# Altium schematic sheet GNT604PWRR4.SchDoc
size B
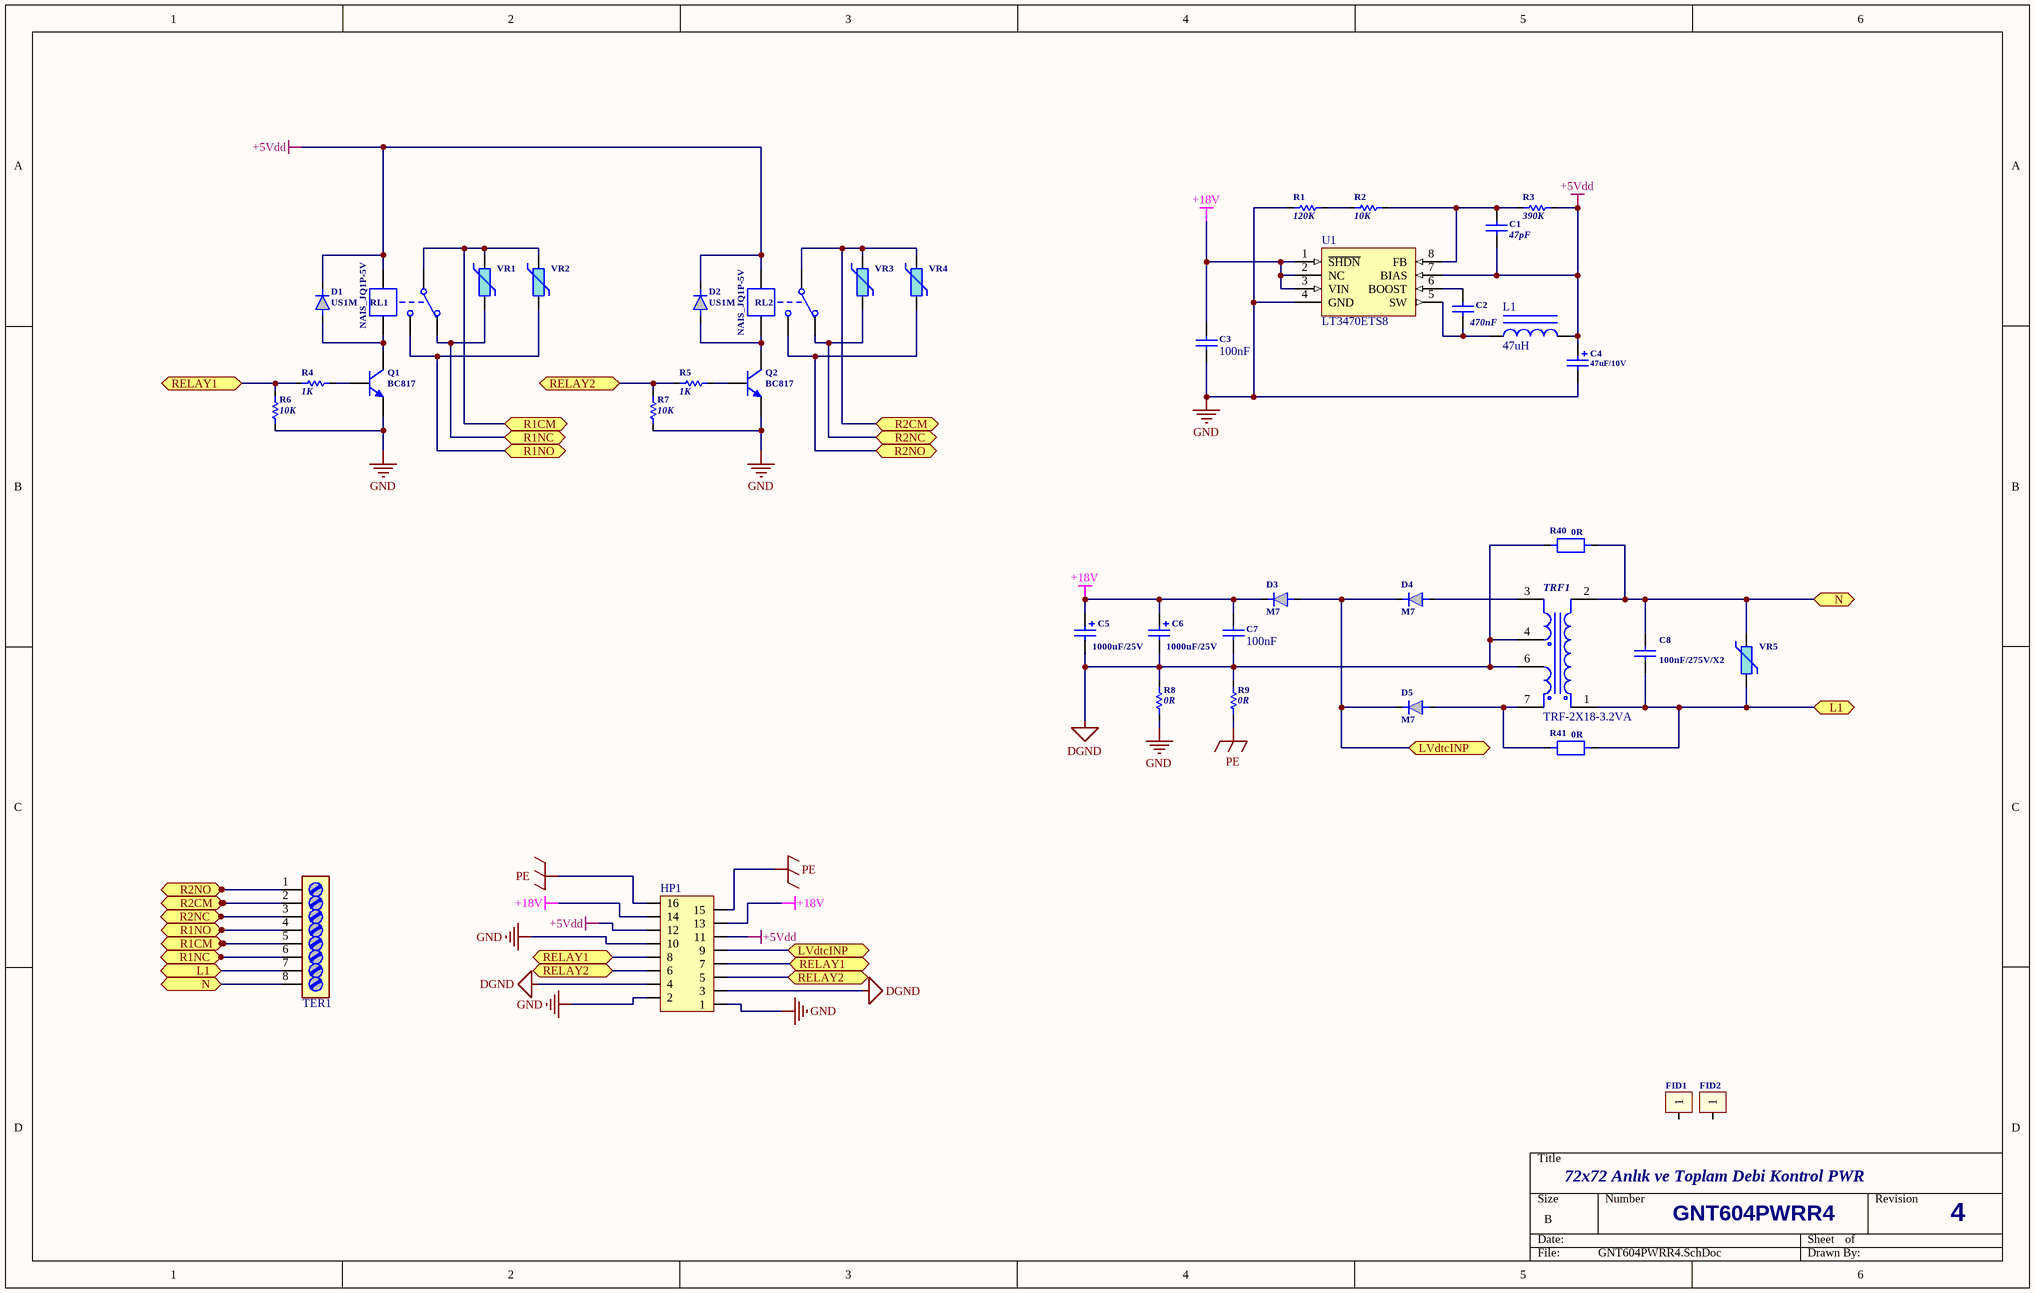
[diagram p0: GNT604PWRR4.SchDoc]

## Parts
C1  47pF  [CC0805]
C2  470nF  [CC0805]
C3  100nF  [CC0805]
C4  47uF/10V  [CAPSMDTANTAL-B]
C5  1000uF/25V  [CAP5.08POL-10.16]
C6  1000uF/25V  [CAP5.08POL-10.16]
C7  100nF  [CC0805]
C8  100nF/275V/X2  [CAPAXIAL/275V/X2]
D1  US1M  [CD-SMA_DO214]
D2  US1M  [CD-SMA_DO214]
D3  M7  [CD-SMA_DO214]
D4  M7  [CD-SMA_DO214]
D5  M7  [CD-SMA_DO214]
FID1  FIDUCIAL1  [FIDUCIAL1]  (value not drawn)
FID2  FIDUCIAL1  [FIDUCIAL1]  (value not drawn)
HP1  DS1015-05_CONFLY  [HeaderAntenk90Pin16]  (value not drawn)
L1  47uH  [INDC2.5X3.3]
Q1  BC817  [SOT23_N]
Q2  BC817  [SOT23_N]
R1  120K  [CR0805]
R2  10K  [CR0805]
R3  390K  [CR0805]
R4  1K  [CR0805]
R5  1K  [CR0805]
R6  10K  [CR0805]
R7  10K  [CR0805]
R8  0R  [CR0805]
R9  0R  [CR0805]
R40  0R  [RES_AXIAL2W]
R41  0R  [RES_AXIAL2W]
RL1  NAIS_JQ1P-5V  [NAIS_JQ1P-XXV]
RL2  NAIS_JQ1P-5V  [NAIS_JQ1P-XXV]
TER1  Terminal_H5.08x8  [Terminal_H5.08x8]  (value not drawn)
TRF1  TRF-2X18-3.2VA  [TRF-EI38/13,5]
U1  LT3470ETS8  [TS8_N]
VR1  TVR07431  [TVR07431]  (value not drawn)
VR2  TVR07431  [TVR07431]  (value not drawn)
VR3  TVR07431  [TVR07431]  (value not drawn)
VR4  TVR07431  [TVR07431]  (value not drawn)
VR5  TVR07431  [TVR07431]  (value not drawn)

## Ports
L1 (bidir), LVdtcINP (bidir), N (bidir), R1CM (bidir), R1NC (bidir), R1NO (bidir), R2CM (bidir), R2NC (bidir), R2NO (bidir), RELAY1 (bidir), RELAY2 (bidir)

## Nets
+5Vdd: C1.2 C4.1(+) D1.2(K) D2.2(K) HP1.11 HP1.12 L1.2 R3.2 RL1.4(A1) RL2.4(A1) U1.7(BIAS)
+18V: C3.2 C5.1(+) C6.1(+) C7.2 D3.2(K) HP1.13 HP1.14 U1.1(~{SHDN}) U1.2(NC) U1.3(VIN)
DGND: C5.2(-) C6.2(-) C7.1 HP1.3 HP1.4 R8.1 R9.1 R40.1 TRF1.4(Sec1-) TRF1.6(Sec2+)
GND: C3.1 C4.2(-) HP1.1 HP1.2 HP1.10 Q1.2(E) Q2.2(E) R1.2 R6.2 R7.2 R8.2 U1.4(GND)
PE: HP1.15 HP1.16 R9.2
L1: C8.2 R41.2 TER1.7 TRF1.1(Pri+) VR5.1 ; port L1
LVdtcINP: D3.1(A) D4.2(K) D5.2(K) HP1.9 ; port LVdtcINP
N: C8.1 R40.2 TER1.8 TRF1.2(Pri-) VR5.2 ; port N
R1CM: RL1.1(COM) TER1.5 VR1.2 VR2.2 ; port R1CM
R1NC: RL1.2(NC) TER1.6 VR1.1 ; port R1NC
R1NO: RL1.3(NO) TER1.4 VR2.1 ; port R1NO
R2CM: RL2.1(COM) TER1.2 VR3.2 VR4.2 ; port R2CM
R2NC: RL2.2(NC) TER1.3 VR3.1 ; port R2NC
R2NO: RL2.3(NO) TER1.1 VR4.1 ; port R2NO
RELAY1: HP1.7 HP1.8 R4.2 R6.1 ; port RELAY1
RELAY2: HP1.5 HP1.6 R5.2 R7.1 ; port RELAY2
NetC1_1: C1.1 R2.1 R3.1 U1.8(FB)
NetC2_1: C2.1 U1.6(BOOST)
NetC2_2: C2.2 L1.1 U1.5(SW)
NetD1_1: D1.1(A) Q1.3(C) RL1.5(A2)
NetD2_1: D2.1(A) Q2.3(C) RL2.5(A2)
NetD4_1: D4.1(A) TRF1.3(Sec1+)
NetD5_1: D5.1(A) R41.1 TRF1.7(Sec2-)
NetQ1_1: Q1.1(B) R4.1
NetQ2_1: Q2.1(B) R5.1
NetR1_1: R1.1 R2.2

Not connected (* = marked no-connect by the designer): FID1 1; FID2 1

## Notes on the sheet
- 72x72 Anlık ve Toplam Debi Kontrol PWR
- GNT604PWRR4
- 4

## Library data of the parts
C1 C2 = CC-0805: Ceramic Chip Capacitor - Standard; Note: Footprint corresponds to dimensions for bulk cassette packaging. This case size has tightened tolerances.; Value: 100nF; Published: 17-Jul-2002; LatestRevisionDate: 19-Mar-2004; LatestRevisionNote: Silkscreen size reduced.; DatasheetDocument: Mar-2001; PackageDocument: Mar-2001; PackageReference: 0805; Publisher: Altium Limited; Code_JEITA: 0805; Code_IPC: 2012[0805]; ComponentLink1Description: Manufacturer Link; ComponentLink1URL: http://www.kemet.com/; ComponentLink2Description: Datasheet; ComponentLink2URL: http://www.kemet.com/kemet/web/homepage/kechome.nsf/vapubfilesname/F3102TA.pdf/$file/F3102TA.pdf
C3 C7 = CC-0805: Ceramic Chip Capacitor - Standard
C4 = CAPSMDTANTAL-B: CA45 Chip Tantalum Capacitors; Published: *; Publisher: *; Manufacturer: *; Class: *; SubClass: *
C5 C6 = CAP AXIAL POL10.16: Polarized Capacitor - Standard
C8 = CAP AXIAL SER: Ceramic Capacitor - Standard
D1 D2 = US1M: ChipDiodeSMA, ultra fast diode
D3-D5 = CD-SMA_DO214: ChipDiodeSMA
HP1 = Header Antenk90PinF16: Header, 16-Pin, 90 DEGREES; Revision: 17-Jul-2002: Re-released for DXP Platform.; Publisher: Altium Limited
L1 = Inductor Iron_47uH: Magnetic-Core Inductor_SMD; Published: 24-Mar-1999; Revision: July-2002: Re-released for DXP Platform.; Publisher: Altium Limited
Q1 Q2 = BC817-40: NPN General Purpose Amplifier; Text Field7: Published 29-Sep-2000
R1-R9 = CR-0805: ChipResistor0805; Published: 8-Jun-2000; LatestRevisionDate: 17-Jul-2002; LatestRevisionNote: Re-released for DXP Platform.; PackageReference: AXIAL-0.3; Publisher: Altium Limited
R40 R41 = RESISTOR AXIAL 2W: Axial Resistor 2W
RL1 RL2 = NAIS_JQ1P-24V: Single-Pole Dual-Throw Relay; Published: 24-Mar-1999; Revision: July-2002: Re-released for DXP Platform.; Publisher: Altium Limited
TER1 = Terminal_H5.08x8: Terminal Block Horizontal 5.08mm 8 pin
TRF1 = TRF-2X18-3.2VA: Text Field7: Published 8-Jun-2000
U1 = LT3470ETS8: 200mA, Micropower Buck Regulator; Note: 1916; Published: 30-May-2008; DatasheetVersion: Aug-2007; PackageVersion: revA, 2000; PackageReference: MS8; Publisher: Altium Limited; PackageDescription: 8-Pin Thin Small Outline Package 0.65 mm Pitch; ComponentLink1Description: Manufacturer Link; ComponentLink1URL: http://www.linear.com/; ComponentLink2Description: Datasheet; ComponentLink2URL: http://www.linear.com/pc/downloadDocument.do?navId=H0,C1,C1003,C1040,C1055,P1378,D3343
VR1-VR5 = TVR07431: Varistor (Voltage-Sensitive Resistor)-275V; Published: 24-Mar-1999; Revision: July-2002: Re-released for DXP Platform.; Publisher: Altium Limited